# EasyEDA Pro project ProPrj_ai交互控制系统_2026-10-29.epro, board PCB2
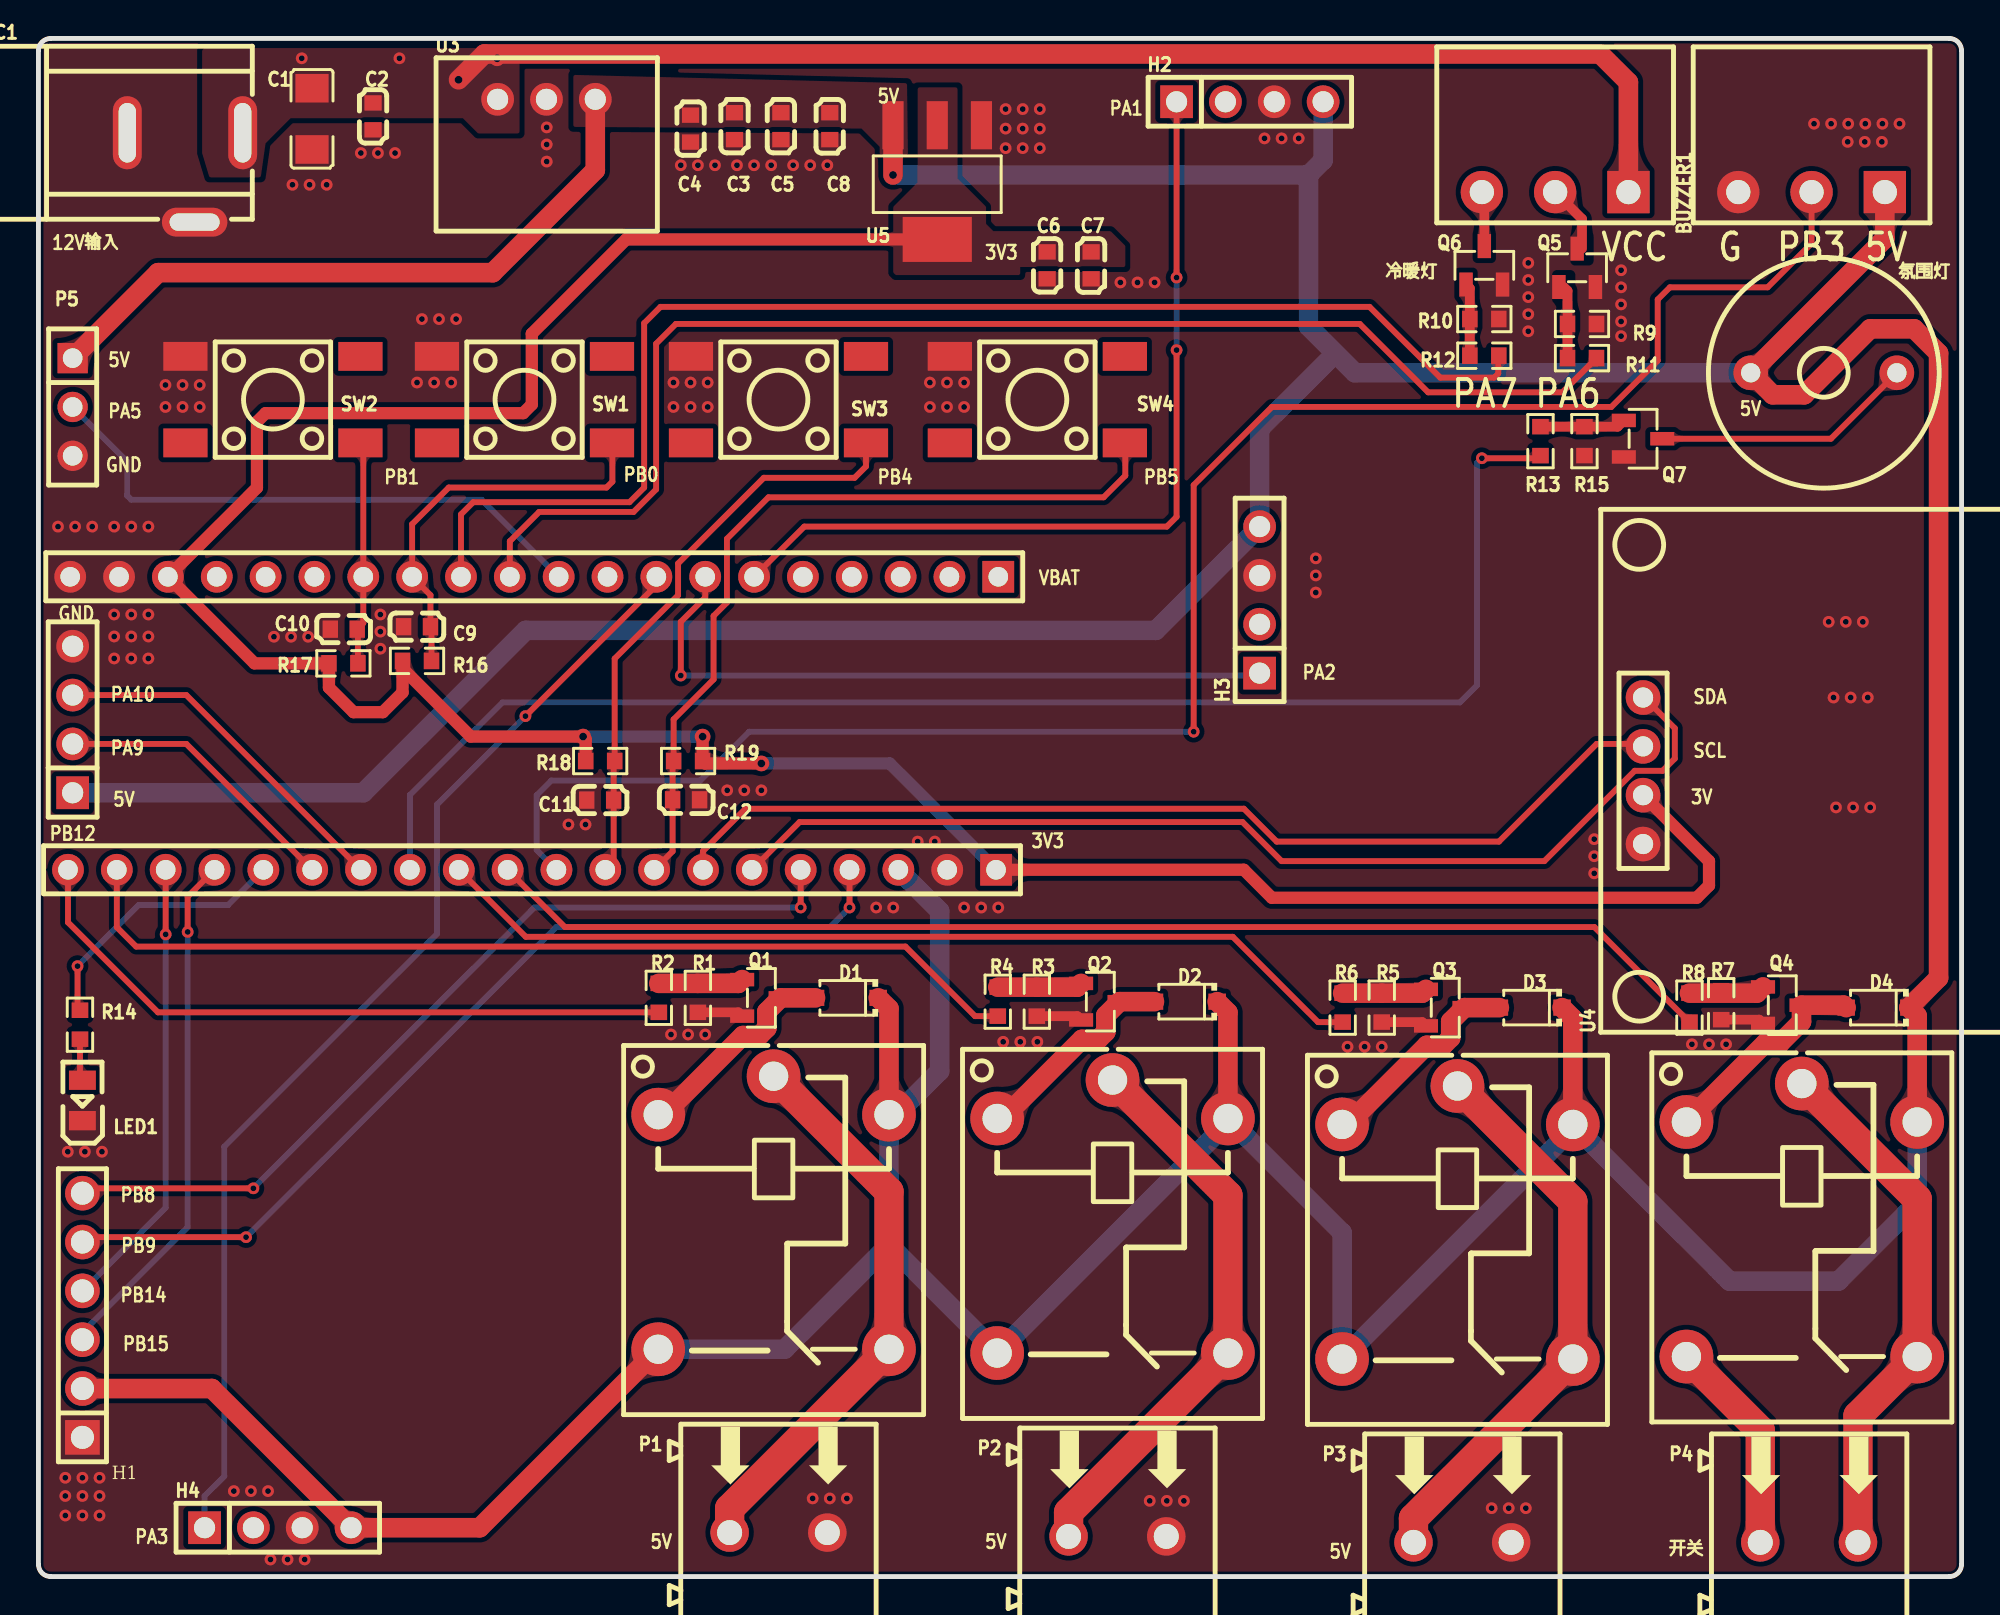
[diagram p2: board, top side]
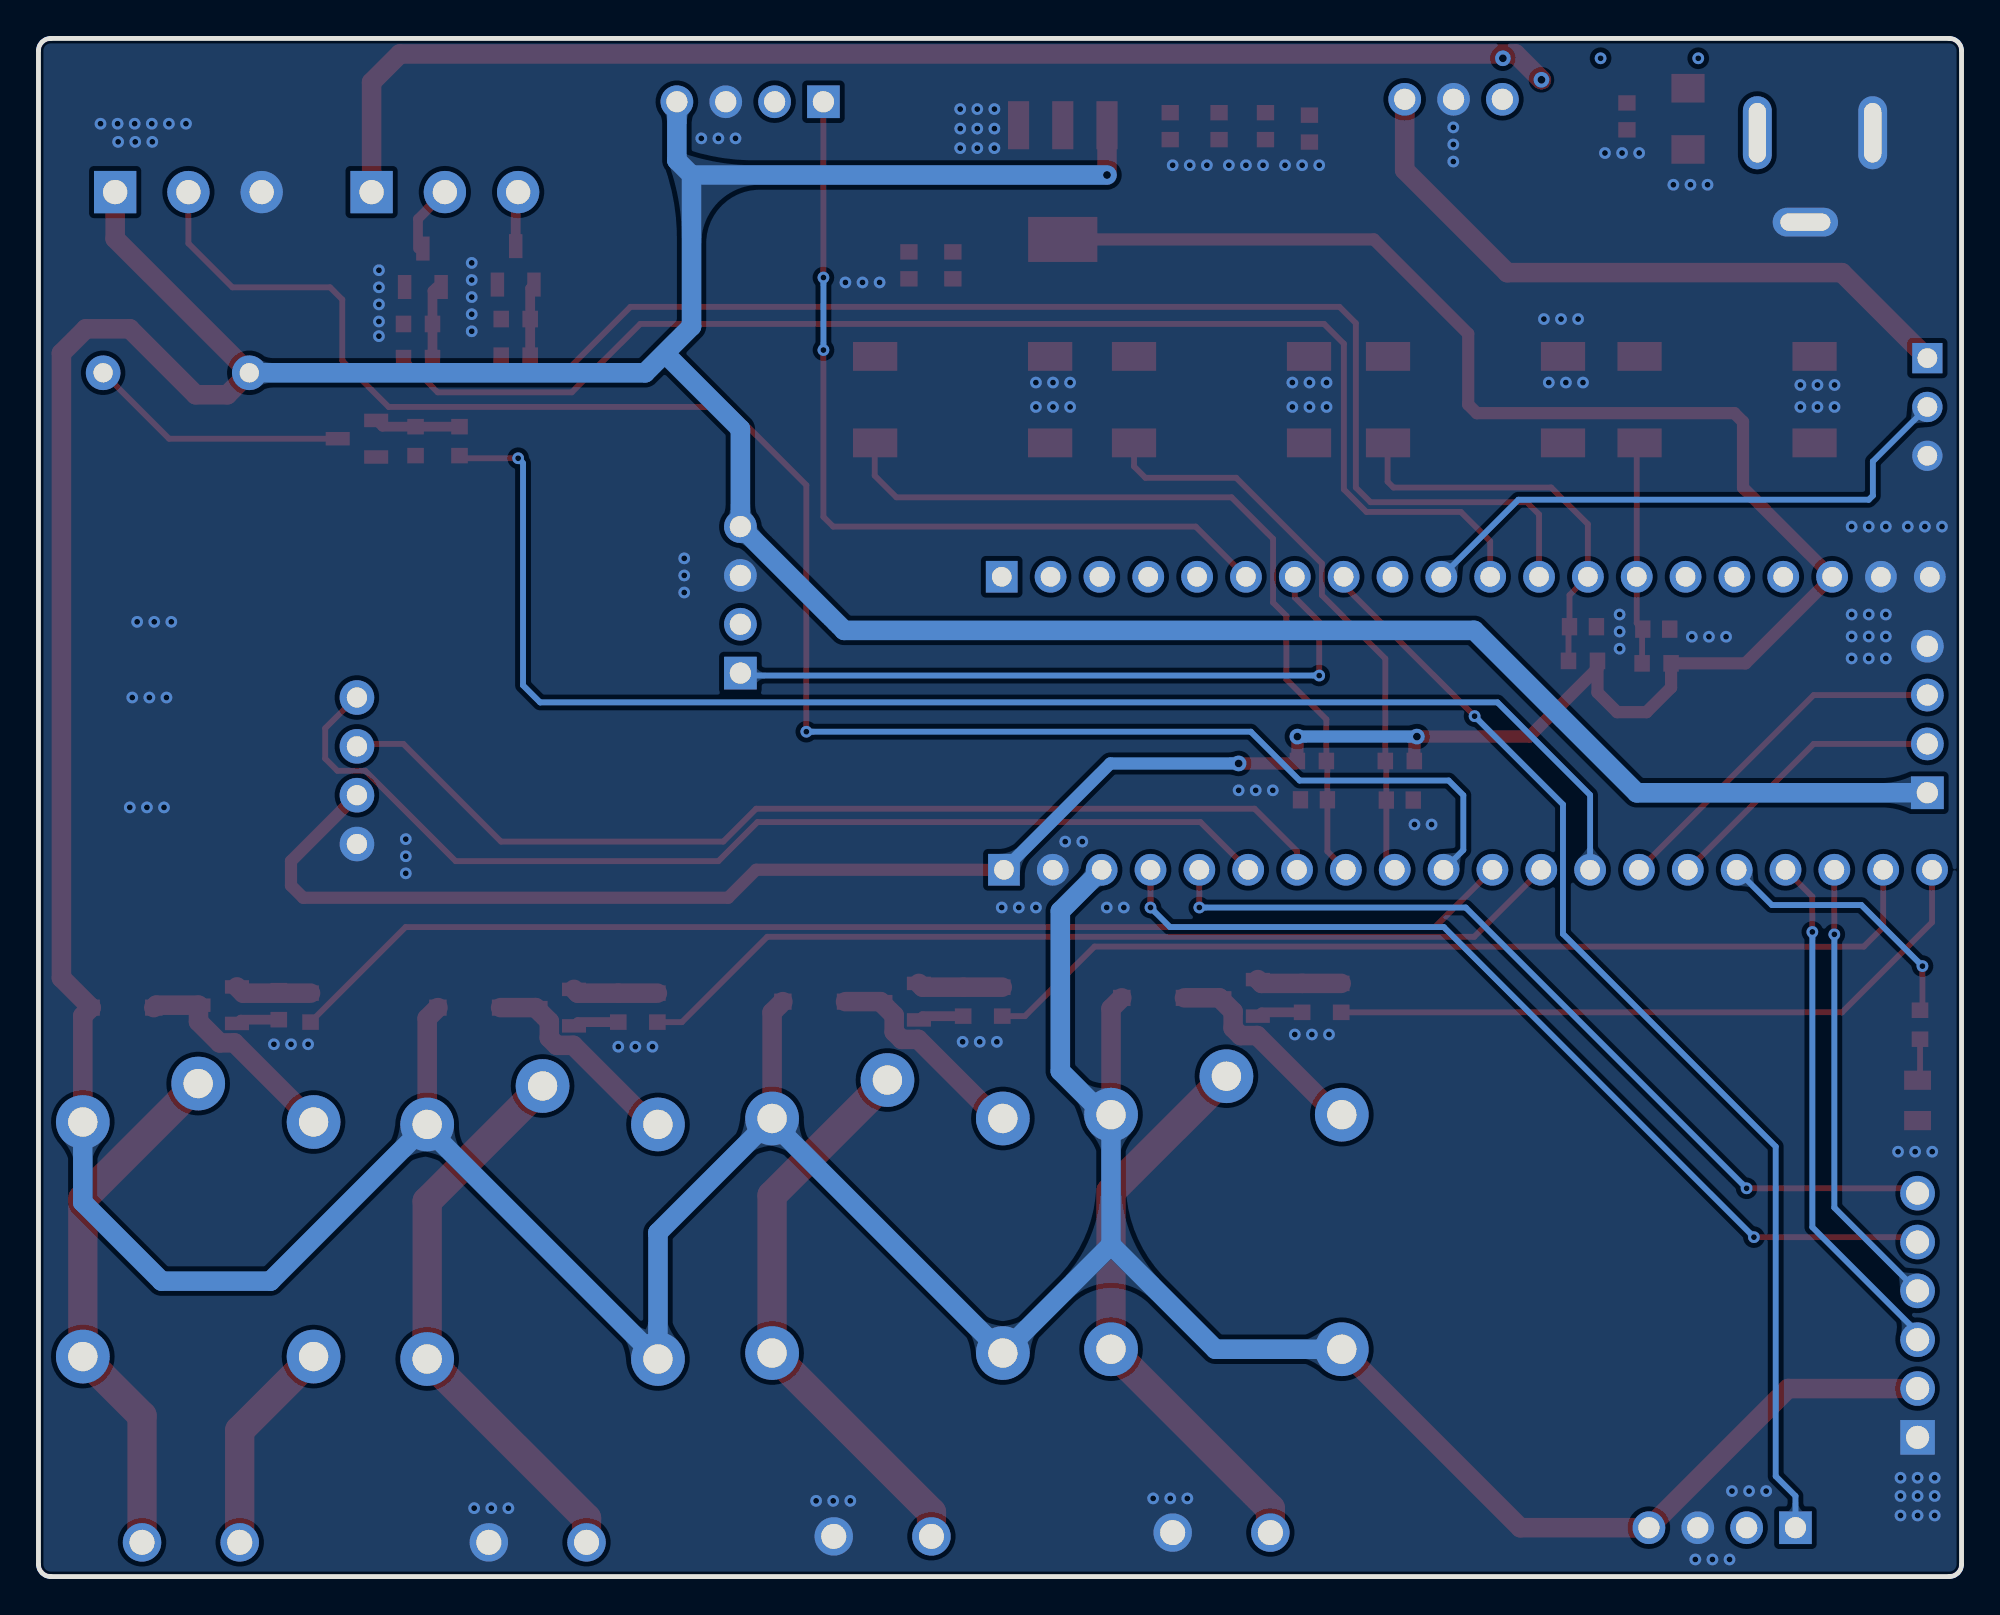
[diagram p3: board, bottom side, seen from below]

Outline 100 x 80 mm; copper layers: Top Layer, Bottom Layer. Coordinates in mm from the lower left corner of the outline.
Outline path: 0,79.36 0,0.63 arc(0.19,0.19) 0.64,0 99.37,0 arc(99.81,0.19) 100,0.63 100,79.36 arc(99.81,79.81) 99.37,80 0.64,80 arc(0.19,79.81) 0,79.36
Stack: Top Layer 0.035mm / Dielectric1 1.51mm FR4 er 4.5 / Bottom Layer 0.035mm

## Design rules (mm)
spacing copperThickness1oz: track to track 0.102, other pairs 0.152 to 0.305
spacing copperThickness2oz (default): track to track 0.203, other pairs 0.152 to 0.3
track width signal (default): min 0.127, default 0.305, max 2.54
track width 3.3: min 0.203, default 0.635, max 2.54
track width 5v主: min 0.127, default 1.016, max 2.54
differential pair differentialPair (default): width min 0.127, default 0.254, max 2.54; gap min 0.152, default 0.152
net 5V uses 5v主, copperRegion_copperThickness2oz, power
net VCC uses copperRegion_copperThickness2oz
net GND uses 3.3, copperRegion_copperThickness2oz, power
net 3V3 uses 3.3, copperRegion_copperThickness2oz, power
net VBAT uses power
pour e460 uses copperRegion_default, default

## Placement (name value [footprint] x y rotation side)
BUZZER1  2.7kHz  [BUZ-TH_BD12.0-P7.60-D0.6-FD]  92.84 62.61 0 top
C1  10uF  [C1206]  14.22 75.82 90 top
C2  100nF  [C0603_2]  17.4 75.95 90 top
C3  100nF  [C0603_2]  36.19 75.44 90 top
C4  22uF  [C0603_2]  33.91 75.31 90 top
C5  22uF  [C0603_2]  38.61 75.44 90 top
C6  22uF  [C0603_2]  52.45 68.2 90 top
C7  100nF  [C0603_3]  54.74 68.2 90 top
C8  100nF  [C0603_3]  41.15 75.44 90 top
C9  100nF  [C0603_3]  19.69 49.4 0 top
C10  100nF  [C0603_3]  15.88 49.28 0 top
C11  100nF  [C0603_3]  29.21 40.39 0 top
C12  100nF  [C0603_3]  33.68 40.4 180 top
D1  1N4148W  [SOD-123_L3.1-W1.7-LS3.7-RD]  42.04 30.1 180 top
D2  1N4148W  [SOD-123_L3.1-W1.7-LS3.7-RD]  59.66 29.9 180 top
D3  1N4148W  [SOD-123_L3.1-W1.7-LS3.7-RD]  77.6 29.59 180 top
D4  1N4148W  [SOD-123_L3.1-W1.7-LS3.7-RD]  95.63 29.59 180 top
DC1  DC-005-A200  [DC-IN-TH_DC-005-A200_1]  7.62 72.77 0 top
H1  2.54-1x6P直针  [HDR-TH_6P-P2.54-V-M-1]  2.29 13.59 90 top
H2  PM254V-11-04-H85  [HDR-TH_4P-P2.54-V-F]  62.99 76.71 0 top
H3  PM254V-11-04-H85  [HDR-TH_4P-P2.54-V-F]  63.5 50.8 90 top
H4  PM254V-11-04-H85  [HDR-TH_4P-P2.54-V-F]  12.45 2.54 0 top
H5  PZ254V-11-04P  [HDR-TH_4P-P2.54-V-M]  1.78 44.58 90 top
LED1  SZYY0805R  [LED0805-R-RD]  2.29 24.77 90 top
P1  WJ500V-5.08-2P  [CONN-TH_2P-P5.00_WJ500V-5.08-2P]  38.48 2.29 0 top
P2  WJ500V-5.08-2P  [CONN-TH_2P-P5.00_WJ500V-5.08-2P]  56.11 2.09 0 top
P3  WJ500V-5.08-2P  [CONN-TH_2P-P5.00_WJ500V-5.08-2P]  74.04 1.78 0 top
P4  WJ500V-5.08-2P  [CONN-TH_2P-P5.00_WJ500V-5.08-2P]  92.07 1.78 0 top
P5  2.54-1*3P母  [HDR-TH_3P-P2.54-V-F]  1.78 60.83 270 top
P6  WJ15EDGRC-3.81-03P-14-00A  [CONN-TH_3P-P3.81_WJ15EDGRC-3.81-3P]  78.87 72.01 180 top
P7  WJ15EDGRC-3.81-03P-14-00A  [CONN-TH_3P-P3.81_WJ15EDGRC-3.81-3P]  92.2 72.01 180 top
Q1  S8050  [SOT-23-3_L2.9-W1.3-P1.90-LS2.4-BR]  37.59 30.1 180 top
Q2  S8050  [SOT-23-3_L2.9-W1.3-P1.90-LS2.4-BR]  55.22 29.9 180 top
Q3  S8050  [SOT-23-3_L2.9-W1.3-P1.90-LS2.4-BR]  73.15 29.59 180 top
Q4  S8050  [SOT-23-3_L2.9-W1.3-P1.90-LS2.4-BR]  90.68 29.72 180 top
Q5  AO3400A  [SOT-23-3_L2.9-W1.3-P1.90-LS2.4-BR_1]  80.01 68.07 270 top
Q6  AO3400A  [SOT-23-3_L2.9-W1.3-P1.90-LS2.4-BR_1]  75.18 68.2 270 top
Q7  S8050  [SOT-23-3_L2.9-W1.3-P1.90-LS2.4-BR_2]  83.44 59.18 180 top
R1  10kΩ  [R0603]  34.29 30.1 90 top
R2  1kΩ  [R0603]  32.26 30.1 90 top
R3  10kΩ  [R0603]  51.91 29.9 90 top
R4  1kΩ  [R0603]  49.88 29.9 90 top
R5  10kΩ  [R0603]  69.85 29.59 90 top
R6  1kΩ  [R0603]  67.82 29.59 90 top
R7  10kΩ  [R0603]  87.5 29.72 90 top
R8  1kΩ  [R0603]  85.85 29.59 90 top
R9  100kΩ  [R0603_1]  80.26 65.15 180 top
R10  100kΩ  [R0603_1]  75.18 65.41 180 top
R11  100Ω  [R0603_1]  80.26 63.37 180 top
R12  100Ω  [R0603_1]  75.18 63.5 180 top
R13  1kΩ  [R0603_2]  78.1 59.06 90 top
R14  10kΩ  [R0603_2]  2.16 28.7 270 top
R15  10kΩ  [R0603_2]  80.39 59.06 90 top
R16  10kΩ  [R0603]  19.69 47.62 180 top
R17  10kΩ  [R0603]  15.86 47.5 180 top
R18  10kΩ  [R0603]  29.21 42.42 180 top
R19  10kΩ  [R0603]  33.78 42.42 0 top
RLY1  SRD-05VDC-SL-C  [RELAY-TH_SRD-XXVDC-XL-C]  38.23 18.92 270 top
RLY2  SRD-05VDC-SL-C  [RELAY-TH_SRD-XXVDC-XL-C]  55.85 18.72 270 top
RLY3  SRD-05VDC-SL-C  [RELAY-TH_SRD-XXVDC-XL-C]  73.79 18.41 270 top
RLY4  SRD-05VDC-SL-C  [RELAY-TH_SRD-XXVDC-XL-C]  91.69 18.54 270 top
SW1  KH-6X6X5H-STM  [SW-SMD_4P-L6.0-W6.0-P4.50-LS9.0_H5.0]  25.27 61.21 180 top
SW2  KH-6X6X5H-STM  [SW-SMD_4P-L6.0-W6.0-P4.50-LS9.0_H5.0]  12.19 61.21 180 top
SW3  KH-6X6X5H-STM  [SW-SMD_4P-L6.0-W6.0-P4.50-LS9.0_H5.0]  38.48 61.21 180 top
SW4  KH-6X6X5H-STM  [SW-SMD_4P-L6.0-W6.0-P4.50-LS9.0_H5.0]  51.94 61.21 180 top
U1  PM254-1-20-Z-8.5  [HDR-TH_20P-P2.54-V-F-2]  25.78 52 180 top
U2  PM254-1-20-Z-8.5  [HDR-TH_20P-P2.54-V-F-2]  25.67 36.76 180 top
U3  K7805-1000R3  [PWRM-TH_K78XX-2000]  26.42 76.83 0 top
U4  HS96L03W2C03  [OLED-TH_L27.8-W27.2-P2.54_C9900033791]  83.44 41.91 90 top
U5  AMS1117-3.3  [SOT-223-3_L6.5-W3.4-P2.30-LS7.0-BR_1]  46.74 72.52 90 top

## Footprints (pads in the part's own frame, mm; a bottom-side part is the same pattern mirrored in y, then rotated)
BUZ-TH_BD12.0-P7.60-D0.6-FD
  round 1.8 hole 1: 1(-3.8,0) 2(3.8,0)
C0603_2
  rect 0.8x0.9 smd: 1(-0.7,0) 2(0.7,0)
C0603_3
  rect 0.8x0.9 smd: 1(-0.7,0) 2(0.7,0)
C1206
  rect 1.485x1.728 smd: 1(-1.593,0) 2(1.593,0)
CONN-TH_2P-P5.00_WJ500V-5.08-2P
  round 2 hole 1.3: 1(-2.54,0) 2(2.54,0)
CONN-TH_3P-P3.81_WJ15EDGRC-3.81-3P
  rect 2.2x2.2 hole 1.26: 1(-3.81,0)
  round 2.2 hole 1.26: 2(0,0) 3(3.81,0)
DC-IN-TH_DC-005-A200_1
  oval 1.5x3.8 hole 0.9x3.1: 1(2.999,2.325) 2(-3,2.325)
  oval 3.4x1.5 hole 2.6x0.9: 3(0.5,-2.325)
HDR-TH_3P-P2.54-V-F
  rect 1.575x1.575 hole 1.02: 1(-2.54,0)
  round 1.575 hole 1.02: 2(0,0) 3(2.54,0)
HDR-TH_4P-P2.54-V-F
  rect 1.7x1.7 hole 1.1: 1(-3.81,0)
  round 1.7 hole 1.1: 2(-1.27,0) 3(1.27,0) 4(3.81,0)
HDR-TH_4P-P2.54-V-M
  rect 1.7x1.7 hole 1.1: 1(-3.81,0)
  round 1.7 hole 1.1: 2(-1.27,0) 3(1.27,0) 4(3.81,0)
HDR-TH_6P-P2.54-V-M-1
  rect 1.8x1.8 hole 1.2: 1(-6.35,0)
  round 1.8 hole 1.2: 2(-3.81,0) 3(-1.27,0) 4(1.27,0) 5(3.81,0) 6(6.35,0)
HDR-TH_20P-P2.54-V-F-2
  rect 1.65x1.65 hole 1.02: 1(-24.13,0)
  round 1.65 hole 1.02: 2(-21.59,0) 3(-19.05,0) 4(-16.51,0) 5(-13.97,0) 6(-11.43,0) 7(-8.89,0) 8(-6.35,0) 9(-3.81,0) 10(-1.27,0) 11(1.27,0) 12(3.81,0) 13(6.35,0) 14(8.89,0) 15(11.43,0) 16(13.97,0) 17(16.51,0) 18(19.05,0) 19(21.59,0) 20(24.13,0)
LED0805-R-RD
  rect 1x1.399 smd: 1(1.05,0) 2(-1.05,0)
OLED-TH_L27.8-W27.2-P2.54_C9900033791
  round 1.8 hole 1.05: 1(-3.81,0) 2(-1.27,0) 3(1.27,0) 4(3.81,0)
PWRM-TH_K78XX-2000
  round 1.7 hole 1.1: 1(-2.54,0) 2(0,0) 3(2.54,0)
R0603
  rect 0.806x0.864 smd: 1(-0.753,0) 2(0.753,0)
R0603_1
  rect 0.806x0.864 smd: 1(-0.753,0) 2(0.753,0)
R0603_2
  rect 0.806x0.864 smd: 1(-0.753,0) 2(0.753,0)
RELAY-TH_SRD-XXVDC-XL-C
  round 2.794 hole 1.524: 1(-5.1,-6) 2(7.1,-6) 3(7.1,6) 4(-5.1,6) 5(-7.1,0)
SOD-123_L3.1-W1.7-LS3.7-RD
  rect 0.91x0.84 smd: 1(-1.63,0) 2(1.63,0)
SOT-23-3_L2.9-W1.3-P1.90-LS2.4-BR
  rect 1.25x0.7 smd: 1(1,-0.95) 2(1,0.95) 3(-1,0)
SOT-23-3_L2.9-W1.3-P1.90-LS2.4-BR_1
  rect 1.25x0.7 smd: 1(1,-0.95) 2(1,0.95) 3(-1,0)
SOT-23-3_L2.9-W1.3-P1.90-LS2.4-BR_2
  rect 1.25x0.7 smd: 1(1,-0.95) 2(1,0.95) 3(-1,0)
SOT-223-3_L6.5-W3.4-P2.30-LS7.0-BR_1
  rect 2.5x1.1 smd: 1(2.97,-2.3) 2(2.97,0) 3(2.97,2.3)
  rect 2.34x3.6 smd: 4(-2.97,0)
SW-SMD_4P-L6.0-W6.0-P4.50-LS9.0_H5.0
  rect 2.3x1.5 smd: 1(-4.55,2.25) 2(4.55,2.25) 3(-4.55,-2.25) 4(4.55,-2.25)

## Nets
As in the schematic.

Pads without a net: H2 2; H3 2; H4 2; SW1 2 3; SW2 2 3; SW3 2 3; SW4 2 3

## Via types
v1: diameter 0.813, hole 0.406, Top Layer to Bottom Layer, 6 vias
v2: diameter 0.61, hole 0.305, Top Layer to Bottom Layer, 178 vias

## Routing (per net, layer and track width the routed paths; a pad name or vN(x,y) marks a point on that pad's centre or on a via; arc(x,y) is an arc through that point)
3V3: length 150.7
  Top Layer w0.635: v1(34.54,43.69) R19.2 34.66,42.29 v1(37.59,42.29) ; R18.2 28.46,43.55 v1(28.32,43.69) 22.48,43.69 18.93,47.24 ; U5.4 30.56,69.55 25.65,64.64 25.65,60.96 25.2,60.51 11.81,60.51 11.36,60.06 11.36,56.63 U1.18 11.23,47.5 R17.2 15.1,46.24 16.38,44.96 17.91,44.96 18.93,45.98 18.93,47.24 ; 18.93,47.24 R16.2 ; U4.2 86.87,37.21 86.87,35.94 86.23,35.31 64.13,35.31 62.68,36.76 U2.1
  Bottom Layer w0.635: v1(34.54,43.69) v1(28.32,43.69) ; v1(37.59,42.29) 44.26,42.29 U2.1
5V: length 414.2
  Top Layer w1.016: D2.1 61.85,29.34 RLY2.4 ; 79.79,23.52 79.79,29.03 D3.1 ; U3.3 28.96,73.15 23.62,67.82 6.22,67.82 P5.1 ; RLY4.4 97.69,29.16 D4.1 98.81,31.14 98.81,63.63 97.54,64.9 95.25,64.9 91.82,61.47 90.18,61.47 BUZZER1.1 96.01,69.59 P7.1 ; H1.2 9.02,9.78 H4.4 22.94,2.54 RLY1.2 ; RLY1.4 44.23,29.54 D1.1 ; U5.3 v1(44.44,72.9)
  Bottom Layer w1.016: BUZZER1.1 68.45,62.61 66.04,65.02 66.04,72.9 ; RLY4.4 97.69,19.46 93.6,15.37 87.94,15.37 79.79,23.52 79.79,23.31 RLY3.2 67.79,17.89 RLY2.4 61.85,23.62 RLY2.2 44.23,17.25 ; 66.04,72.9 66.8,73.66 H2.4 ; 66.04,72.9 v1(44.44,72.9) ; U2.3 46.86,34.61 46.86,26.29 44.6,24.02 RLY1.4 44.23,17.25 ; RLY1.2 38.8,11.82 44.23,17.25 ; H5.1 16.89,40.77 25.34,49.21 58.1,49.21 H3.4 63.5,59.69 67.18,63.37
GND: length 9.4
  Top Layer w0.508: R7.1 89.48,28.96 Q4.2 ; R1.1 36.4,29.35 Q1.2 ; Q3.2 71.96,28.84 R5.1 ; R3.1 54.02,29.15 Q2.2
  vias: v2(1.02,54.61) v2(1.4,5.14) v2(1.4,4.19) v2(1.4,3.18) v2(1.52,22.1) v2(1.91,54.61) v2(2.29,5.14) v2(2.29,4.19) v2(2.29,3.18) v2(2.41,22.1) v2(2.79,54.61) v2(3.17,5.14) v2(3.17,4.19) v2(3.17,3.18) v2(3.3,22.1) v2(3.94,54.61) v2(3.94,50.04) v2(3.94,48.89) v2(3.94,47.75) v2(4.83,54.61) v2(4.83,50.04) v2(4.83,48.89) v2(4.83,47.75) v2(5.72,54.61) v2(5.72,50.04) v2(5.72,48.89) v2(5.72,47.75) v2(6.6,61.98) v2(6.6,60.83) v2(7.49,61.98) v2(7.49,60.83) v2(8.38,61.98) v2(8.38,60.83) v2(10.16,4.44) v2(11.05,4.44) v2(11.94,4.44) v2(12.06,0.89) v2(12.25,48.88) v2(12.95,0.89) v2(13.13,48.88) v2(13.21,72.39) v2(13.84,0.89) v2(14.02,48.88) v2(14.1,72.39) v2(14.99,72.39) v2(16.76,74.04) v2(17.65,74.04) v2(17.78,50.04) v2(17.78,49.15) v2(17.78,48.26) v2(18.54,74.04) v2(19.69,62.1) v2(19.94,65.41) v2(20.57,62.1) v2(20.83,65.41) v2(21.46,62.1) v2(21.72,65.41) v2(26.43,75.37) v2(26.43,74.49) v2(26.43,73.6) v2(27.56,39.12) v2(28.45,39.12) v2(32.89,28.19) v2(33.02,62.1) v2(33.02,60.83) v2(33.4,73.41) v2(33.78,28.19) v2(33.91,62.1) v2(33.91,60.83) v2(34.29,73.41) v2(34.67,28.19) v2(34.8,62.1) v2(34.8,60.83) v2(35.18,73.41) v2(35.81,40.89) v2(36.32,73.41) v2(36.7,40.89) v2(37.21,73.41) v2(37.59,40.89) v2(38.1,73.41) v2(39.24,73.41) v2(40.13,73.41) v2(40.26,4.06) v2(41.02,73.41) v2(41.15,4.06) v2(42.04,4.06) v2(43.56,34.8) v2(44.45,34.8) v2(45.72,38.23) v2(46.35,62.1) v2(46.35,60.83) v2(46.61,38.23) v2(47.24,62.1) v2(47.24,60.83) v2(48.13,62.1) v2(48.13,60.83) v2(48.13,34.8) v2(49.02,34.8) v2(49.91,34.8) v2(50.16,27.81) v2(50.29,76.33) v2(50.29,75.31) v2(50.29,74.3) v2(51.05,27.81) v2(51.18,76.33) v2(51.18,75.31) v2(51.18,74.3) v2(51.94,27.81) v2(52.07,76.33) v2(52.07,75.31) v2(52.07,74.3) v2(56.26,67.31) v2(57.15,67.31) v2(57.78,3.94) v2(58.04,67.31) v2(58.67,3.94) v2(59.56,3.94) v2(63.75,74.8) v2(64.64,74.8) v2(65.53,74.8) v2(66.42,52.96) v2(66.42,52.07) v2(66.42,51.18) v2(68.07,27.56) v2(68.96,27.56) v2(69.85,27.56) v2(75.56,3.56) v2(76.45,3.56) v2(77.34,3.56) v2(77.47,68.33) v2(77.47,67.44) v2(77.47,66.55) v2(77.47,65.66) v2(77.47,64.77) v2(80.9,38.35) v2(80.9,37.47) v2(80.9,36.58) v2(82.3,67.94) v2(82.3,67.06) v2(82.3,66.17) v2(82.3,65.28) v2(82.3,64.52) v2(85.98,27.69) v2(86.87,27.69) v2(87.76,27.69) v2(92.33,75.56) v2(93.09,49.66) v2(93.22,75.56) v2(93.34,45.72) v2(93.47,40) v2(93.98,49.66) v2(94.11,75.56) v2(94.08,74.62) v2(94.23,45.72) v2(94.36,40) v2(94.87,49.66) v2(95,75.56) v2(94.97,74.62) v2(95.12,45.72) v2(95.25,40) v2(95.88,75.56) v2(95.86,74.62) v2(96.77,75.56)
VCC: length 67.7
  Top Layer w1.016: v1(21.84,77.85) 23.19,79.19 81.21,79.19 82.68,77.72 P6.1
  vias: v1(23.85,78.97) v2(13.69,78.97) v2(18.77,78.97)
ADC1_IN1: length 44.9
  Top Layer w0.305: v2(59.18,67.56) H2.1 ; v2(59.18,63.79) 59.18,55.12 58.67,54.61 39.82,54.61 U1.6
  Bottom Layer w0.305: v2(59.18,63.79) v2(59.18,67.56)
ADC1_IN2: length 35.9
  Top Layer w0.305: U1.7 34.67,50.93 33.4,49.66 v2(33.4,46.86)
  Bottom Layer w0.305: v2(33.4,46.86) 63.63,46.86
ADC1_IN3: length 59.2
  Top Layer w0.305: U1.8 32.13,51.56 v2(25.32,44.75)
  Bottom Layer w0.305: v2(25.32,44.75) 20.73,40.16 20.73,33.43 9.66,22.36 9.66,5.22 8.64,4.19 H4.1
DHT11_DATA: length 30
  Bottom Layer w0.305: U1.10 23.04,56.01 4.83,56.01 4.61,56.22 4.61,58 P5.2
OLED_SCL: length 53.6
  Top Layer w0.305: U4.3 83.31,43.31 81.03,43.31 75.95,38.23 64.39,38.23 62.68,39.94 36.76,39.94 34.56,37.73 U2.7
OLED_SDA: length 56
  Top Layer w0.305: U2.6 39.58,39.24 62.61,39.24 64.64,37.21 78.31,37.21 83.01,41.91 84.46,41.91 85.09,42.55 85.09,44.12 83.49,45.72 U4.4
PA6: length 69.7
  Top Layer w0.305: R11.1 79.24,61.59 72.26,61.59 68.71,65.15 33.15,65.15 32.12,64.12 32.12,56.55 30.94,55.37 26.03,55.37 24.51,53.85 U1.11
PA7: length 69.2
  Top Layer w0.305: R12.1 75.91,63.47 75.91,62.57 75.69,62.36 72.9,62.36 69.22,66.04 32.35,66.04 31.5,65.19 31.5,56.64 30.73,55.88 22.61,55.88 21.97,55.25 U1.12
PA8: length 14.1
  Top Layer w0.305: v2(2.03,31.75) 2.03,29.58 R14.1
  Bottom Layer w0.305: U2.16 9.86,34.92 5.21,34.92 v2(2.03,31.75)
PA9: length 15.2
  Top Layer w0.305: H5.2 7.69,43.31 U2.15
PA10: length 18.8
  Top Layer w0.305: U2.14 7.69,45.85 H5.3
PA11: length 76.8
  Top Layer w0.305: v2(75.06,58.17) 77.97,58.17 R13.1
  Bottom Layer w0.305: U2.13 19.31,40.65 24.13,45.47 73.91,45.47 74.8,46.36 74.8,57.91 v2(75.06,58.17)
PA12: length 49.2
  Top Layer w0.305: R6.1 66.54,28.84 62.1,33.27 25.34,33.27 U2.12
PA15: length 64.7
  Top Layer w0.305: U2.11 27.37,33.78 80.91,33.78 R8.1
PB0: length 20.9
  Top Layer w0.305: R16.1 20.44,49.35 C9.2 20.39,51.05 U1.13 19.43,54.74 21.34,56.64 29.54,56.64 29.84,56.95 29.84,58.94 SW1.1
PB1: length 11.7
  Top Layer w0.305: R17.1 16.61,49.24 C10.2 16.89,49.59 U1.14 16.89,58.81 SW2.1
PB3: length 94.5
  Top Layer w0.305: P7.2 92.2,69.34 89.92,67.06 84.84,67.06 84.2,66.42 84.2,63.25 81.79,60.83 64.13,60.83 60.07,56.77 v2(60.07,43.94)
  Bottom Layer w0.305: U2.10 25.91,37.79 25.91,40.64 26.67,41.4 34.42,41.4 36.96,43.94 v2(60.07,43.94)
PB4: length 30.6
  Top Layer w0.305: SW3.1 43.03,57.74 42.44,57.15 37.72,57.15 33.26,52.69 33.26,51.04 29.96,47.74 R18.1 29.91,42.36 C11.2 29.91,37.2 U2.9
PB5: length 42.6
  Top Layer w0.305: 56.49,58.96 56.51,58.94 56.51,57.26 55.39,56.13 37.96,56.13 35.8,53.97 35.8,50.66 35.11,49.96 35.11,46.66 33.03,44.59 R19.1 32.98,42.36 C12.2 32.98,37.72 U2.8
PB8: length 45.5
  Top Layer w0.305: v2(11.18,20.19) 2.54,20.19 H1.6 ; U2.5 v2(39.63,34.8)
  Bottom Layer w0.305: v2(11.18,20.19) 25.78,34.8 v2(39.63,34.8)
PB9: length 49.1
  Top Layer w0.305: v2(10.8,17.65) 2.54,17.65 H1.5 ; U2.4 v2(42.18,34.8)
  Bottom Layer w0.305: v2(10.8,17.65) 26.92,33.78 41.16,33.78 v2(42.18,34.8)
PB12: length 35.4
  Top Layer w0.305: R2.1 6.21,29.35 1.53,34.03 U2.20
PB13: length 50.7
  Top Layer w0.305: U2.19 4.08,33.77 5.08,32.77 45.09,32.77 48.7,29.15 R4.1
PB14: length 23.7
  Top Layer w0.305: U2.18 v2(6.61,33.4)
  Bottom Layer w0.305: v2(6.61,33.4) 6.61,19.19 H1.4
PB15: length 27.3
  Top Layer w0.305: v2(7.76,33.53) 7.76,35.36 U2.17
  Bottom Layer w0.305: H1.3 2.29,12.7 7.76,18.17 v2(7.76,33.53)
$1N27: length 2.1
  Top Layer w0.305: R14.2 2.16,25.82
$1N29: length 4.5
  Top Layer w0.508: R13.2 R15.2 82.12,59.81 Q7.1
$1N30: length 13.6
  Top Layer w0.305: Q7.3 93.21,59.18 BUZZER1.2
$1N36: length 3.8
  Top Layer w0.508: R12.2 R10.2 74.43,67 Q6.1
$1N37: length 2.9
  Top Layer w0.508: Q6.3 75.18,71.88 P6.3
$1N38: length 3.8
  Top Layer w0.508: 79.31,67.07 79.51,66.88 R11.2
$1N39: length 3.5
  Top Layer w0.508: P6.2 80.26,70.61 80.26,69.07
$1N70: length 27.6
  Top Layer w1.524: RLY4.5 97.69,19.64 RLY4.3 94.62,8.36 94.62,1.78
$1N71: length 11.3
  Top Layer w1.524: P4.1 89.53,7.6 RLY4.2
$1N74: length 29.7
  Top Layer w1.524: RLY2.5 61.85,19.83 RLY2.3 53.57,3.34 P2.1
$1N75: length 29.7
  Top Layer w1.524: P1.1 35.94,3.54 RLY1.3 44.23,20.02 RLY1.5
$1N80: length 11.4
  Top Layer w1.016: D4.2 93.87,29.72 Q4.3 91.68,28.86 90.58,27.76 89.81,27.76 RLY4.1
$1N81: length 11.2
  Top Layer w1.016: D3.2 Q3.3 73.44,28.88 73.44,28.02 73.05,27.63 72.19,27.63 68.08,23.52 67.79,23.52
$1N82: length 11.2
  Top Layer w1.016: RLY2.1 50.14,23.83 54.26,27.94 55.12,27.94 55.5,28.33 55.5,29.19 Q2.3 D2.2
$1N83: length 11.2
  Top Layer w1.016: D1.2 Q1.3 37.88,29.38 37.88,28.53 37.49,28.14 36.63,28.14 32.52,24.02 RLY1.1
$1N87: length 4
  Top Layer w1.016: Q4.1 89.35,30.34 R8.2
$1N89: length 4.4
  Top Layer w1.016: Q3.1 71.96,30.34 R5.2 R6.2
$1N91: length 4.4
  Top Layer w1.016: Q2.1 54.02,30.65 R3.2 R4.2
$1N93: length 4.4
  Top Layer w1.016: R2.2 R1.2 36.4,30.85 Q1.1
$1N150: length 29.7
  Top Layer w1.524: 73.79,25.52 79.79,19.52 RLY3.3 71.5,3.03 P3.1

## Copper pours and planes (outline as drawn; the poured copper is in the pictures)
3V3 on Top Layer: 45.72,77.45 45.73,77.46 47.79,77.46 47.79,72.73 49.28,71.25 49.28,70.36 49.66,69.98 55.75,69.98 56.51,69.22 56.51,68.11 51.05,68.12 51.05,67.69 44.58,67.69 44.45,67.82 44.45,71.25 45.72,72.52
5V on Top Layer: 42.8,75.31 27.81,75.4 27.81,78.11 45.16,77.67 45.21,73.91 43.85,73.91 43.75,74.02 43.75,74.36
GND on Top Layer: -12.7,88.52 117.22,88.52 117.22,-13.84 -12.7,-13.84
GND on Bottom Layer: -6.48,83.82 111.12,83.82 111.12,-9.53 -6.48,-9.53
VCC on Top Layer: 8.51,74.04 8.51,79.38 8.64,79.5 24.89,79.5 25.02,79.38 25.02,75.06 22.86,75.06 22.07,75.85 13.11,75.85 11.81,74.55 11.56,72.77 8.89,72.77

Small or netless copper shapes (teardrops, artwork), in the pictures only: 157 on Top Layer, 46 on Bottom Layer

## Text on the board
Top Silkscreen Layer: PB12 | GND | 5V | PA5 | PA10 | PA9 | PB8 | PB14 | PB9 | PB15 | PA3 | PB1 | PB0 | PB4 | 3V3 | VBAT | PA1 | PB5 | PA2 | 3V | SDA | SCL | PA7 | PA6 | VCC | G | PB3 | 12V输入 | 冷暖灯 | 开关 | 氛围灯
